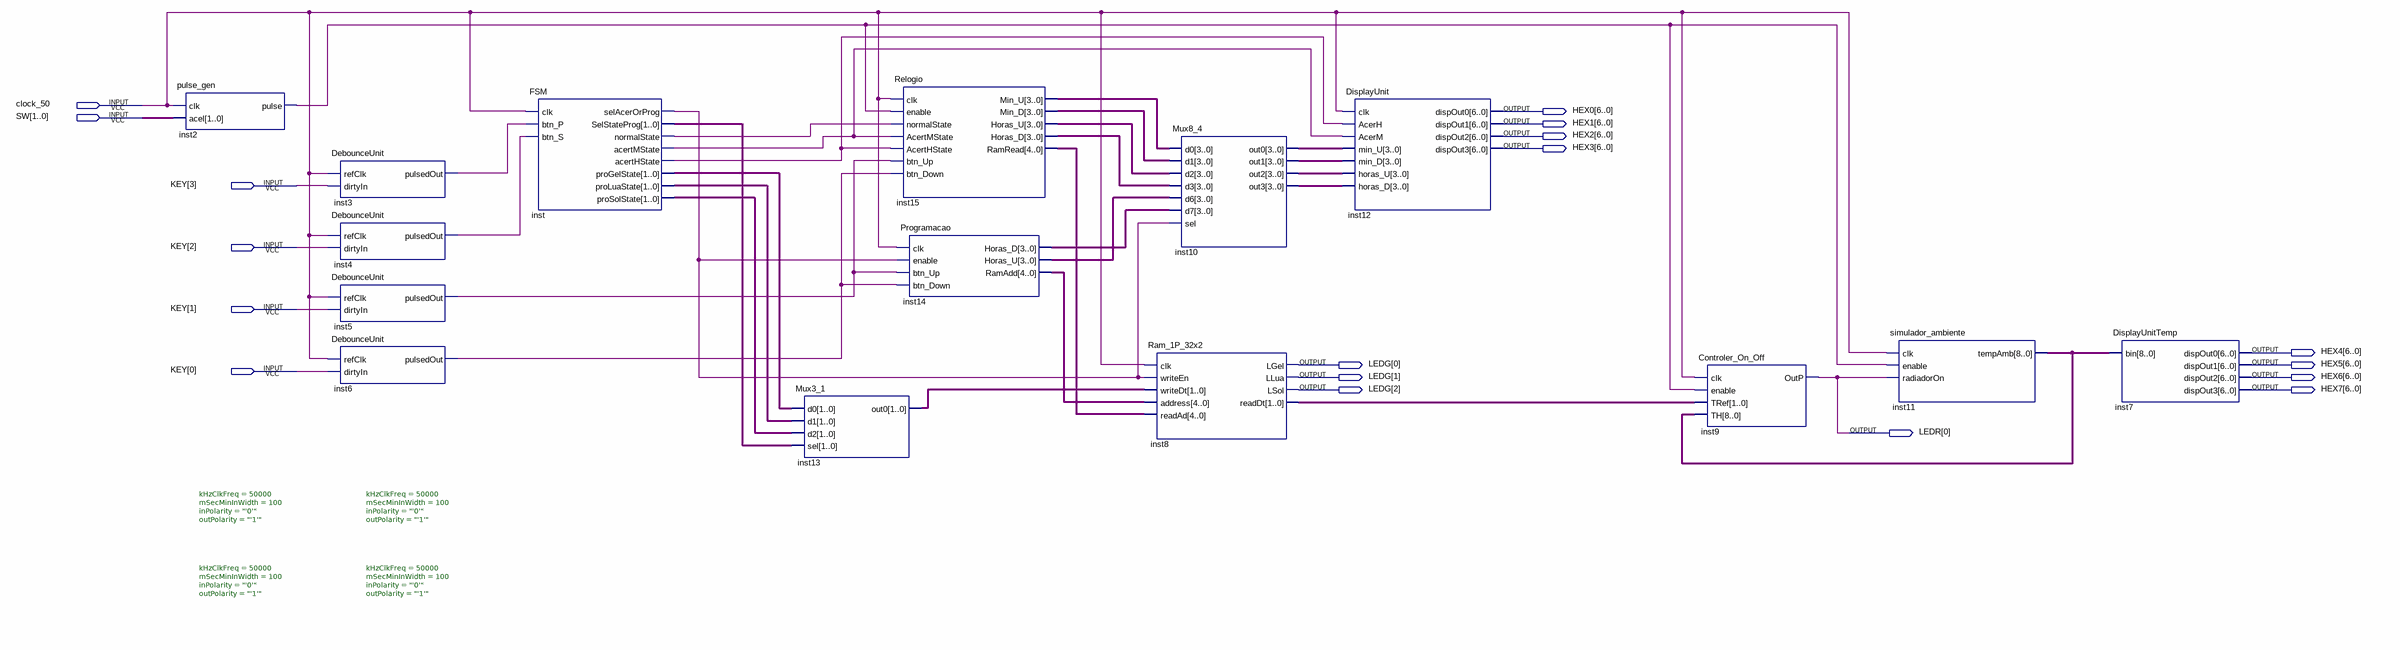
[diagram p0: schematic sheet]
// Quartus schematic Diagrama_Projeto_Final.bdf as structural Verilog: 15 symbols, 18 pins
module Diagrama_Projeto_Final (
  input  clock_50,
  input  [1:0] SW,
  input  [3:0] KEY,
  output [6:0] HEX0,
  output [6:0] HEX1,
  output [6:0] HEX2,
  output [6:0] HEX3,
  output [6:0] HEX4,
  output [2:0] LEDG,
  output [6:0] HEX5,
  output [6:0] HEX6,
  output [6:0] HEX7,
  output [0:0] LEDR
);

  wire inst2_pulse, inst3_pulsedout, inst4_pulsedout, inst5_pulsedout, inst6_pulsedout, inst_acerthstate,
       inst_acertmstate, inst_normalstate, inst_selacerorprog;
  wire [1:0] inst8_readdt, inst13_out0, inst_progelstate, inst_proluastate, inst_prosolstate,
       inst_selstateprog;
  wire [3:0] inst10_out0, inst10_out1, inst10_out2, inst10_out3, inst14_horas_d, inst14_horas_u,
       inst15_horas_d, inst15_horas_u, inst15_min_d, inst15_min_u;
  wire [4:0] inst14_ramadd, inst15_ramread;
  wire [8:0] inst11_tempamb;

  pulse_gen inst2 (.clk(clock_50), .acel(SW), .pulse(inst2_pulse));
  DebounceUnit #(.kHzClkFreq(50000), .mSecMinInWidth(100), .inPolarity("'0'"), .outPolarity("'1'")) inst3 (
    .refClk(clock_50), .dirtyIn(KEY[3]), .pulsedOut(inst3_pulsedout));
  DebounceUnit #(.kHzClkFreq(50000), .mSecMinInWidth(100), .inPolarity("'0'"), .outPolarity("'1'")) inst4 (
    .refClk(clock_50), .dirtyIn(KEY[2]), .pulsedOut(inst4_pulsedout));
  DebounceUnit #(.kHzClkFreq(50000), .mSecMinInWidth(100), .inPolarity("'0'"), .outPolarity("'1'")) inst5 (
    .refClk(clock_50), .dirtyIn(KEY[1]), .pulsedOut(inst5_pulsedout));
  DebounceUnit #(.kHzClkFreq(50000), .mSecMinInWidth(100), .inPolarity("'0'"), .outPolarity("'1'")) inst6 (
    .refClk(clock_50), .dirtyIn(KEY[0]), .pulsedOut(inst6_pulsedout));
  FSM inst (
    .clk(clock_50), .btn_P(inst3_pulsedout), .btn_S(inst4_pulsedout), .selAcerOrProg(inst_selacerorprog),
    .SelStateProg(inst_selstateprog), .normalState(inst_normalstate), .acertMState(inst_acertmstate),
    .acertHState(inst_acerthstate), .proGelState(inst_progelstate), .proLuaState(inst_proluastate),
    .proSolState(inst_prosolstate));
  Mux3_1 inst13 (
    .d0(inst_progelstate), .d1(inst_proluastate), .d2(inst_prosolstate), .sel(inst_selstateprog),
    .out0(inst13_out0));
  Relogio inst15 (
    .clk(clock_50), .enable(inst2_pulse), .normalState(inst_normalstate), .AcertMState(inst_acertmstate),
    .AcertHState(inst_acerthstate), .btn_Up(inst5_pulsedout), .btn_Down(inst6_pulsedout),
    .Min_U(inst15_min_u), .Min_D(inst15_min_d), .Horas_U(inst15_horas_u), .Horas_D(inst15_horas_d),
    .RamRead(inst15_ramread));
  Programacao inst14 (
    .clk(clock_50), .enable(inst_selacerorprog), .btn_Up(inst5_pulsedout), .btn_Down(inst6_pulsedout),
    .Horas_D(inst14_horas_d), .Horas_U(inst14_horas_u), .RamAdd(inst14_ramadd));
  Ram_1P_32x2 inst8 (
    .clk(clock_50), .writeEn(inst_selacerorprog), .writeDt(inst13_out0), .address(inst14_ramadd),
    .readAd(inst15_ramread), .LGel(LEDG[0]), .LLua(LEDG[1]), .LSol(LEDG[2]), .readDt(inst8_readdt));
  Mux8_4 inst10 (
    .d0(inst15_min_u), .d1(inst15_min_d), .d2(inst15_horas_u), .d3(inst15_horas_d), .d6(inst14_horas_u),
    .d7(inst14_horas_d), .sel(inst_selacerorprog), .out0(inst10_out0), .out1(inst10_out1),
    .out2(inst10_out2), .out3(inst10_out3));
  DisplayUnit inst12 (
    .clk(clock_50), .AcerH(inst_acerthstate), .AcerM(inst_acertmstate), .min_U(inst10_out0),
    .min_D(inst10_out1), .horas_U(inst10_out2), .horas_D(inst10_out3), .dispOut0(HEX0), .dispOut1(HEX1),
    .dispOut2(HEX2), .dispOut3(HEX3));
  Controler_On_Off inst9 (
    .clk(clock_50), .enable(inst2_pulse), .TRef(inst8_readdt), .TH(inst11_tempamb), .OutP(LEDR[0]));
  simulador_ambiente inst11 (.clk(clock_50), .enable(inst2_pulse), .radiadorOn(LEDR[0]), .tempAmb(inst11_tempamb));
  DisplayUnitTemp inst7 (.bin(inst11_tempamb), .dispOut0(HEX4), .dispOut1(HEX5), .dispOut2(HEX6), .dispOut3(HEX7));
endmodule
